# Altium project NMEA2K-Converter-v1.0.PrjPcb (part 1 of 3)
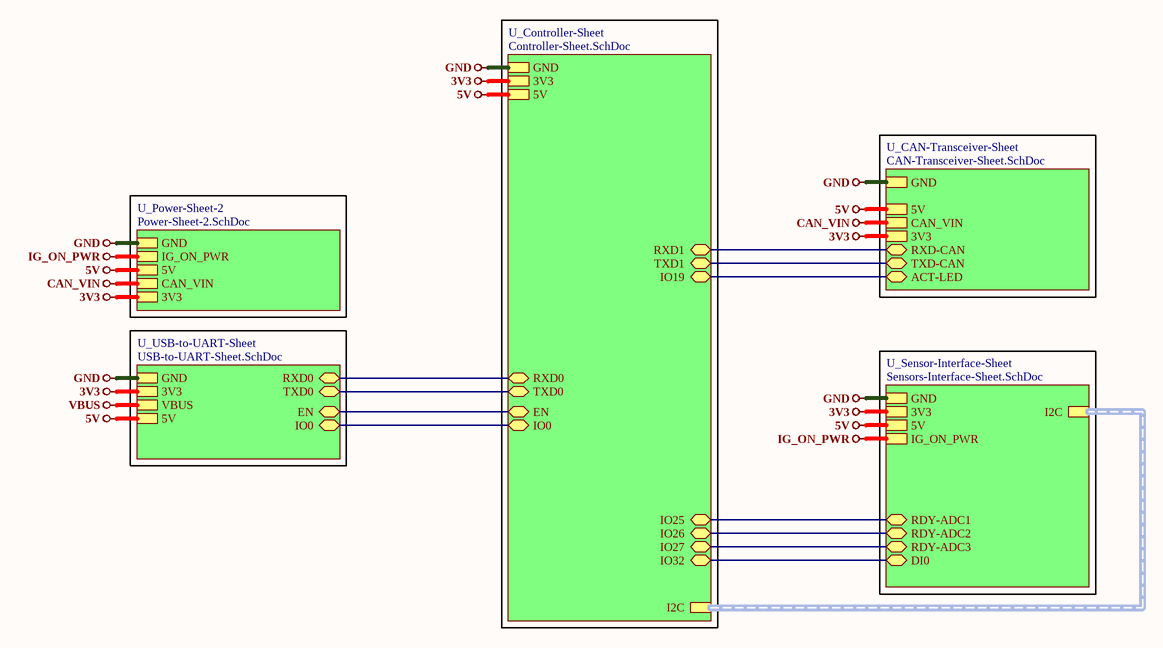
[diagram p0: Top-Sheet.SchDoc]
6 sheets, 138 parts. Net scope: hierarchical (ports join the sheet entries above them; power ports are global).
Board file: NMEA2K-Converter-v1.0.PcbDoc
Sheets:
  Top-Sheet.SchDoc
    U_Power-Sheet-2 = Power-Sheet-2.SchDoc
    U_USB-to-UART-Sheet = USB-to-UART-Sheet.SchDoc
    U_Controller-Sheet = Controller-Sheet.SchDoc
    U_CAN-Transceiver-Sheet = CAN-Transceiver-Sheet.SchDoc
    U_Sensor-Interface-Sheet = Sensors-Interface-Sheet.SchDoc

## Sheet Top-Sheet.SchDoc
size A4; SheetNumber: 1; SheetTotal: 6

### Sub-sheets
U_CAN-Transceiver-Sheet = CAN-Transceiver-Sheet.SchDoc: GND, 3V3, CAN_VIN, RXD-CAN (bidir), TXD-CAN (bidir), ACT-LED (bidir), 5V
U_Controller-Sheet = Controller-Sheet.SchDoc: I2C (harness I2C), GND, 3V3, TXD0 (bidir), RXD0 (bidir), EN (bidir), IO0 (bidir), TXD1 (bidir), RXD1 (bidir), IO25 (bidir), IO26 (bidir), IO27 (bidir), IO19 (bidir), IO32 (bidir), 5V
U_Power-Sheet-2 = Power-Sheet-2.SchDoc: 5V, GND, 3V3, CAN_VIN, IG_ON_PWR
U_Sensor-Interface-Sheet = Sensors-Interface-Sheet.SchDoc: I2C (harness I2C), GND, 3V3, RDY-ADC1 (bidir), RDY-ADC2 (bidir), RDY-ADC3 (bidir), 5V, DI0 (bidir), IG_ON_PWR
U_USB-to-UART-Sheet = USB-to-UART-Sheet.SchDoc: GND, 3V3, EN (bidir), IO0 (bidir), VBUS, RXD0 (bidir), TXD0 (bidir), 5V

### Nets
3V3: sheet U_Power-Sheet-2/3V3, sheet U_USB-to-UART-Sheet/3V3, sheet U_Controller-Sheet/3V3, sheet U_CAN-Transceiver-Sheet/3V3, sheet U_Sensor-Interface-Sheet/3V3
5V: sheet U_Power-Sheet-2/5V, sheet U_USB-to-UART-Sheet/5V, sheet U_Controller-Sheet/5V, sheet U_CAN-Transceiver-Sheet/5V, sheet U_Sensor-Interface-Sheet/5V
CAN_VIN: sheet U_Power-Sheet-2/CAN_VIN, sheet U_CAN-Transceiver-Sheet/CAN_VIN
GND: sheet U_Power-Sheet-2/GND, sheet U_USB-to-UART-Sheet/GND, sheet U_Controller-Sheet/GND, sheet U_CAN-Transceiver-Sheet/GND, sheet U_Sensor-Interface-Sheet/GND
IG_ON_PWR: sheet U_Power-Sheet-2/IG_ON_PWR, sheet U_Sensor-Interface-Sheet/IG_ON_PWR
ACT-LED: sheet U_Controller-Sheet/IO19, sheet U_CAN-Transceiver-Sheet/ACT-LED
DI0: sheet U_Controller-Sheet/IO32, sheet U_Sensor-Interface-Sheet/DI0
EN: sheet U_USB-to-UART-Sheet/EN, sheet U_Controller-Sheet/EN
IO0: sheet U_USB-to-UART-Sheet/IO0, sheet U_Controller-Sheet/IO0
IO25: sheet U_Controller-Sheet/IO25, sheet U_Sensor-Interface-Sheet/RDY-ADC1
IO26: sheet U_Controller-Sheet/IO26, sheet U_Sensor-Interface-Sheet/RDY-ADC2
IO27: sheet U_Controller-Sheet/IO27, sheet U_Sensor-Interface-Sheet/RDY-ADC3
RXD0: sheet U_USB-to-UART-Sheet/RXD0, sheet U_Controller-Sheet/RXD0
RXD-CAN: sheet U_Controller-Sheet/RXD1, sheet U_CAN-Transceiver-Sheet/RXD-CAN
TXD0: sheet U_USB-to-UART-Sheet/TXD0, sheet U_Controller-Sheet/TXD0
TXD-CAN: sheet U_Controller-Sheet/TXD1, sheet U_CAN-Transceiver-Sheet/TXD-CAN

### Buses and harness runs
harness sheet U_Controller-Sheet/I2C = sheet U_Sensor-Interface-Sheet/I2C

### Notes on the sheet
- File:
- Title:
- Date:
- Page
- Num:
- Total:
- Drawn By: Huzaifa Ali

## Sheet Power-Sheet-2.SchDoc
size A4; SheetNumber: 2; SheetTotal: 6
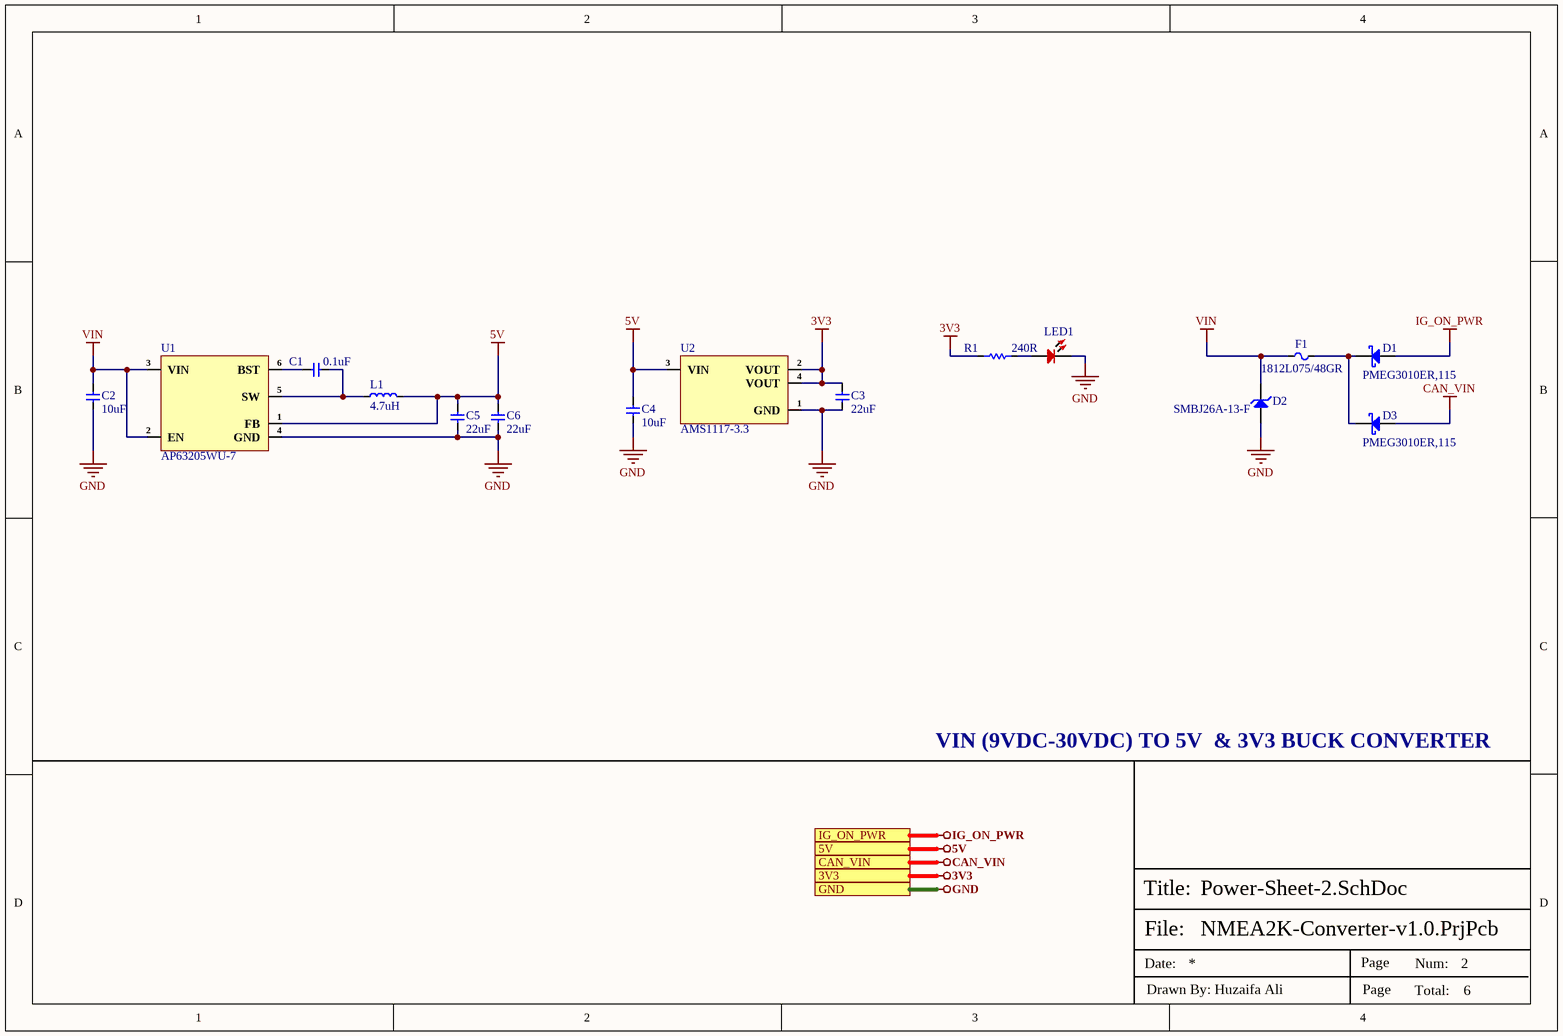
[diagram p1: Power-Sheet-2.SchDoc]

### Parts
C1  0.1uF  [Cap-0402]
C2  10uF  [Cap-1210]
C3  22uF  [Cap-0402]
C4  10uF  [Cap-1210]
C5  22uF  [Cap-0402]
C6  22uF  [Cap-0402]
D1  PMEG3010ER,115  [SOD-123W]
D2  SMBJ26A-13-F  [SMB_]
D3  PMEG3010ER,115  [SOD-123W]
F1  1812L075/48GR  [1812-FUSE]
L1  4.7uH  [SWPA4030S4R7MT_]
LED1  RED  [LED-0603]  (value not drawn)
R1  240R  [Res-0402]
U1  AP63205WU-7  [TSOT-23-6]
U2  AMS1117-3.3  [SOT- 223]

### Ports
3V3 (see Top-Sheet[1B], CAN-Transceiver-Sheet[3D], Controller-Sheet[3D], Sensors-Interface-Sheet[5D], USB-to-UART-Sheet[3D]), 5V (see Top-Sheet[1B], CAN-Transceiver-Sheet[3D], Controller-Sheet[3D], Sensors-Interface-Sheet[5D]), CAN_VIN (see Top-Sheet[1B], CAN-Transceiver-Sheet[3D]), GND (see Top-Sheet[1B], CAN-Transceiver-Sheet[3D], Controller-Sheet[3D], Sensors-Interface-Sheet[5D], USB-to-UART-Sheet[3D]), IG_ON_PWR (see Top-Sheet[1B], Sensors-Interface-Sheet[5D])

### Nets
3V3: C3.2 R1.1 U2.2(VOUT) U2.4(VOUT) ; port 3V3
5V: C4.2 C5.2 C6.2 L1.2 U1.1(FB) U2.3(VIN) ; port 5V
CAN_VIN: D3.1(A) ; port CAN_VIN
GND: C2.1 C3.1 C4.1 C5.1 C6.1 D2.1(A) LED1.2 U1.4(GND) U2.1(GND) ; port GND
IG_ON_PWR: D1.1(A) ; port IG_ON_PWR
VIN: C2.2 D2.2(K) F1.1 U1.2(EN) U1.3(VIN)
NetC1_1: C1.1 L1.1 U1.5(SW)
NetC1_2: C1.2 U1.6(BST)
NetD1_2: D1.2(K) D3.2(K) F1.2
NetLED1_1: LED1.1 R1.2

### Notes on the sheet
- VIN (9VDC-30VDC) TO 5V  & 3V3 BUCK CONVERTER
- File:
- Title:
- Date:
- Page
- Num:
- Total:
- Drawn By: Huzaifa Ali

### Library data of the parts
C1 = CL05B104KB54PNC: CAP CER 0.1UF 50V X7R 0402; Manufacturer: Samsung; Supplier 1: Digi-Key; Manufacturer Part Number: CL05B104KB54PNC; Stock 1: 8594; Pricing 1: 1=0.1, 10=0.067, 50=0.0366, 100=0.0299, 500=0.02138, 1000=0.01681, 2500=0.01528, 5000=0.01406 (USD); Supplier Part Number 1: 1276-CL05B104KB54PNCDKR-ND; LCSC Part Number: C307331
C2 C4 = GRM32ER71J106KA12L: Multilayer Ceramic Capacitors MLCC - SMD/SMT 1210 10uF 63volts *Derate Voltage/Temp; Manufacturer: Murata; Supplier: Avnet; Supplier Part Number: GRM32ER71J106KA12L; Manufacturer Part Number: GRM32ER71J106KA12L; RoHS: Yes; Category: Ceramic Capacitors; Stock: 55000; Pricing: 1000=0.3451, 2000=0.33698, 4000=0.32886, 6000=0.32074, 8000=0.31262 (USD); ComponentLink1URL: http://www.mouser.com/ds/2/281/c02e-2905.pdf?src-supplier=Mouser; ComponentLink1Description: http://www.mouser.com/ds/2/281/c02e-2905.pdf?src-supplier=Mouser; ComponentLink2URL: http://www.farnell.com/datasheets/2079202.pdf?src-supplier=Farnell; ComponentLink2Description: http://www.farnell.com/datasheets/2079202.pdf?src-supplier=Farnell; ComponentLink3URL: http://search.murata.co.jp/Ceramy/image/img/A01X/G101/ENG/GRM32ER71J106KA12-01.pdf?src-supplier=Digi-Key; ComponentLink3Description: http://search.murata.co.jp/Ceramy/image/img/A01X/G101/ENG/GRM32ER71J106KA12-01.pdf?src-supplier=Digi-Key; ComponentLink4URL: https://datasheet.octopart.com/GRM32ER71J106KA12L-Murata-datasheet-22122223.pdf?src-supplier=Future+Electronics; ComponentLink4Description: https://datasheet.octopart.com/GRM32ER71J106KA12L-Murata-datasheet-22122223.pdf?src-supplier=Future+Electronics; ComponentLink5URL: http://psearch.en.murata.com/capacitor/product/GRM32ER71J106KA12%23.pdf?src-supplier=Avnet; ComponentLink5Description: http://psearch.en.murata.com/capacitor/product/GRM32ER71J106KA12%23.pdf?src-supplier=Avnet; ComponentLink6URL: http://www.farnell.com/datasheets/2079202.pdf?src-supplier=Newark; ComponentLink6Description: http://www.farnell.com/datasheets/2079202.pdf?src-supplier=Newark; ComponentLink7URL: http://www.farnell.com/datasheets/2079202.pdf?src-supplier=Element14; ComponentLink7Description: http://www.farnell.com/datasheets/2079202.pdf?src-supplier=Element14; Package: 1210; LCSC Part Number: C437568; Item Type: Capacitor; ComponentLink8Description: LCSC; ComponentLink8URL: https://www.lcsc.com/product-detail/Multilayer-Ceramic-Capacitors-MLCC-SMD-SMT_Murata-Electronics-GRM32ER71J106KA12L_C437568.html
C3 C5 C6 = GRM158R61A226ME15D: CAP CER 22UF 10V X5R 0402; Item Type: Capacitor; Material: 4241ConductorMaterial; Dielectric: 1537DielectricType; Tolerance: 20%; Supplier: Digi-Key; Supplier Part Number: 490-GRM158R61A226ME15DCT-ND; RoHS: Yes; Category: Ceramic Capacitors; Stock: 26634; Pricing: 1=0.45, 10=0.299, 50=0.2202, 100=0.1794, 500=0.1416, 1000=0.11957, 2500=0.11328 (USD); Case/Package: 343Case; Min Operating Temperature: -55°C; Max Operating Temperature: 85°C; Value: 22uF; Voltage Rating: 10V; Voltage Rating (DC): 10V; Length: 1mm; Width: 500um; Height: 800um; Thickness: 800um
D1 D3 = PMEG3010ER,115: DIODE SCHOTTKY 30V 1A SOD123W; Manufacturer: Nexperia; Supplier 1: Digi-Key; Manufacturer Part Number: PMEG3010ER,115; Stock 1: 72983; Pricing 1: 1=0.35, 10=0.282, 25=0.258, 100=0.162, 250=0.1602, 500=0.15, 1000=0.102 (USD); Supplier Part Number 1: 1727-5201-1-ND; LCSC Part Number: C456106
D2 = SMBJ26A-13-F: TVS DIODE 26VWM 42.1VC SMB; Manufacturer: Diodes; Item Type: TVS Diodes; Supplier: Future Electronics; Supplier Part Number: 3363900; Manufacturer Part Number: SMBJ26A-13-F; RoHS: Yes; Stock: 9000; Pricing: 3000=0.0717, 9000=0.069, 15000=0.0677, 30000=0.0661, 60000=0.0635 (USD); ComponentLink1URL: https://datasheet.ciiva.com/15143/getdatasheetpartid-118169-15143570.pdf?src-supplier=Verical; ComponentLink1Description: https://datasheet.ciiva.com/15143/getdatasheetpartid-118169-15143570.pdf?src-supplier=Verical; ComponentLink2URL: https://datasheet.ciiva.com/16211/ds19002-16211003.pdf?src-supplier=Future+Electronics; ComponentLink2Description: https://datasheet.ciiva.com/16211/ds19002-16211003.pdf?src-supplier=Future+Electronics; LCSC Part Number: C135062
F1 = 1812L075/48GR: 48V 750mA 1.5A 1812 Resettable Fuses ROHS; Manufacturer: LUTE; Manufacturer Part Number: 1812L075/48GR; Package: 1812; LCSC Part Number: C19193053; Item Type: Fuses; ComponentLink1Description: LCSC; ComponentLink1URL: https://www.lcsc.com/product-detail/Resettable-Fuses_LUTE-1812L075-48GR_C19193053.html
L1 = SWPA4030S4R7MT: Fixed Ind 4.720%UH 0.06 Ohm 3200M; Manufacturer: Sunlord; Supplier 1: Digi-Key; Manufacturer Part Number: SWPA4030S4R7MT; RoHS: Yes; Category: Fixed Inductors; Stock 1: 3730; Pricing 1: 1=0.44000, 10=0.38900, 25=0.36120, 50=0.30560, 100=0.27780, 250=0.26108, 500=0.23332, 1000=0.18887 (USD); RoHS Compliant: Yes; Supplier Part Number 1: 3442-SWPA4030S4R7MTCT-ND; LCSC Part Number: C57269
LED1 = NCD0603R3: RED LED 0603 Light Emitting Diodes; Manufacturer: Foshan NationStar Optoelectronics; Manufacturer Part Number: NCD0603R3; Package: 0603; Item Type: LED; LCSC Part Number: C3151730; ComponentLink1Description: LCSC; ComponentLink1URL: https://www.lcsc.com/product-detail/Light-Emitting-Diodes-LED_Foshan-NationStar-Optoelectronics-NCD0603R3_C3151730.html
R1 = RC0402FR-07240RL: RES 240 OHM 1% 1/16W 0402; Manufacturer: Yageo; Power Rating: 63mW; Temperature Coefficient: 100ppm/°C; Voltage Rating (DC): 50V; Supplier 1: Mouser; Manufacturer Part Number: RC0402FR-07240RL; RoHS: Yes; Category: Chip SMD Resistors; Stock 1: 1903202; Pricing 1: 1=0.10000, 10=0.01200, 50=0.01200, 100=0.00500, 1000=0.00300, 10000=0.00100 (USD); Case/Package: 0402; Case Code (Metric): 1005; Case Code (Imperial): 0402; Size Code: 0402; Min Operating Temperature: -55°C; Max Operating Temperature: 155°C; Resistance: 240R; Tolerance: 1%; Packaging: Tape and Reel; Resistor Type: Thick Film; Voltage Rating: 50V; Package Quantity: 1; Number of Terminations: 2; Termination: SMD/SMT; Max Power Dissipation: 63mW; Features: Moisture Resistant; Series: RC; Construction: Rectangular; Resistance Tolerance: 1%; Length: 1mm; Width: 0.02inch; Height: 0.016inch; Depth: 0.5mm; REACH SVHC: Unknown; Lead Free: Lead Free; RoHS Compliant: Yes; Military Standard: Not; ComponentLink1URL: https://datasheet.ciiva.com/7849/1018594-7849915.pdf?src-supplier=Element14; ComponentLink1Description: https://datasheet.ciiva.com/7849/1018594-7849915.pdf?src-supplier=Element14; ComponentLink2URL: https://datasheet.ciiva.com/7849/1018594-7849916.pdf?src-supplier=Element14; ComponentLink2Description: https://datasheet.ciiva.com/7849/1018594-7849916.pdf?src-supplier=Element14; ComponentLink3URL: https://datasheet.ciiva.com/2519/pyu-r-int-thick-7-2519157.pdf?src-supplier=Digi-Key; ComponentLink3Description: https://datasheet.ciiva.com/2519/pyu-r-int-thick-7-2519157.pdf?src-supplier=Digi-Key; ComponentLink4URL: https://datasheet.ciiva.com/2519/pyu-r-int-thick-7-2519158.pdf?src-supplier=Digi-Key; ComponentLink4Description: https://datasheet.ciiva.com/2519/pyu-r-int-thick-7-2519158.pdf?src-supplier=Digi-Key; ComponentLink5URL: https://datasheet.ciiva.com/2519/pyu-r-int-thick-7-2519156.pdf?src-supplier=Digi-Key; ComponentLink5Description: https://datasheet.ciiva.com/2519/pyu-r-int-thick-7-2519156.pdf?src-supplier=Digi-Key; ComponentLink6URL: https://datasheet.ciiva.com/12669/pyu-rc0402-51-rohs-l-6-r-12669689.pdf?src-supplier=Mouser; ComponentLink6Description: https://datasheet.ciiva.com/12669/pyu-rc0402-51-rohs-l-6-r-12669689.pdf?src-supplier=Mouser; ComponentLink7URL: https://datasheet.ciiva.com/17419/pyu-rc0402-51-rohs-l-6-r-17419482.pdf?src-supplier=Future+Electronics; ComponentLink7Description: https://datasheet.ciiva.com/17419/pyu-rc0402-51-rohs-l-6-r-17419482.pdf?src-supplier=Future+Electronics; Supplier Part Number 1: 603-RC0402FR-07240RL
U1 = AP63205WU-7: IC REG BUCK 5V 2A TSOT26; Manufacturer: Diodes; Supplier 1: Digi-Key; Manufacturer Part Number: AP63205WU-7; RoHS: Yes; Category: Voltage Regulators - Switching; Stock 1: 88525; Pricing 1: 1=0.88, 10=0.776, 25=0.7292, 100=0.5952, 250=0.55284, 500=0.4705, 1000=0.3764 (USD); Supplier Part Number 1: AP63205WU-7DICT-ND; LCSC Part Number: C2071056; Item Type: IC
U2 = AMS1117-3.3: SOT-223 Linear Voltage Regulators (LDO) ROHS; Manufacturer: GUOXIN JIAPIN SEMICONDUCTOR; Item Type: IC; Manufacturer Part Number: AMS1117-3.3; Package: SOT-223; LCSC Part Number: C2992570; ComponentLink1Description: LCSC; ComponentLink1URL: https://www.lcsc.com/product-detail/Linear-Voltage-Regulators-LDO_GUOXIN-JIAPIN-SEMICONDUCTOR-AMS1117-3-3_C2992570.html

## Sheet USB-to-UART-Sheet.SchDoc
size A4; SheetNumber: 3; SheetTotal: 6
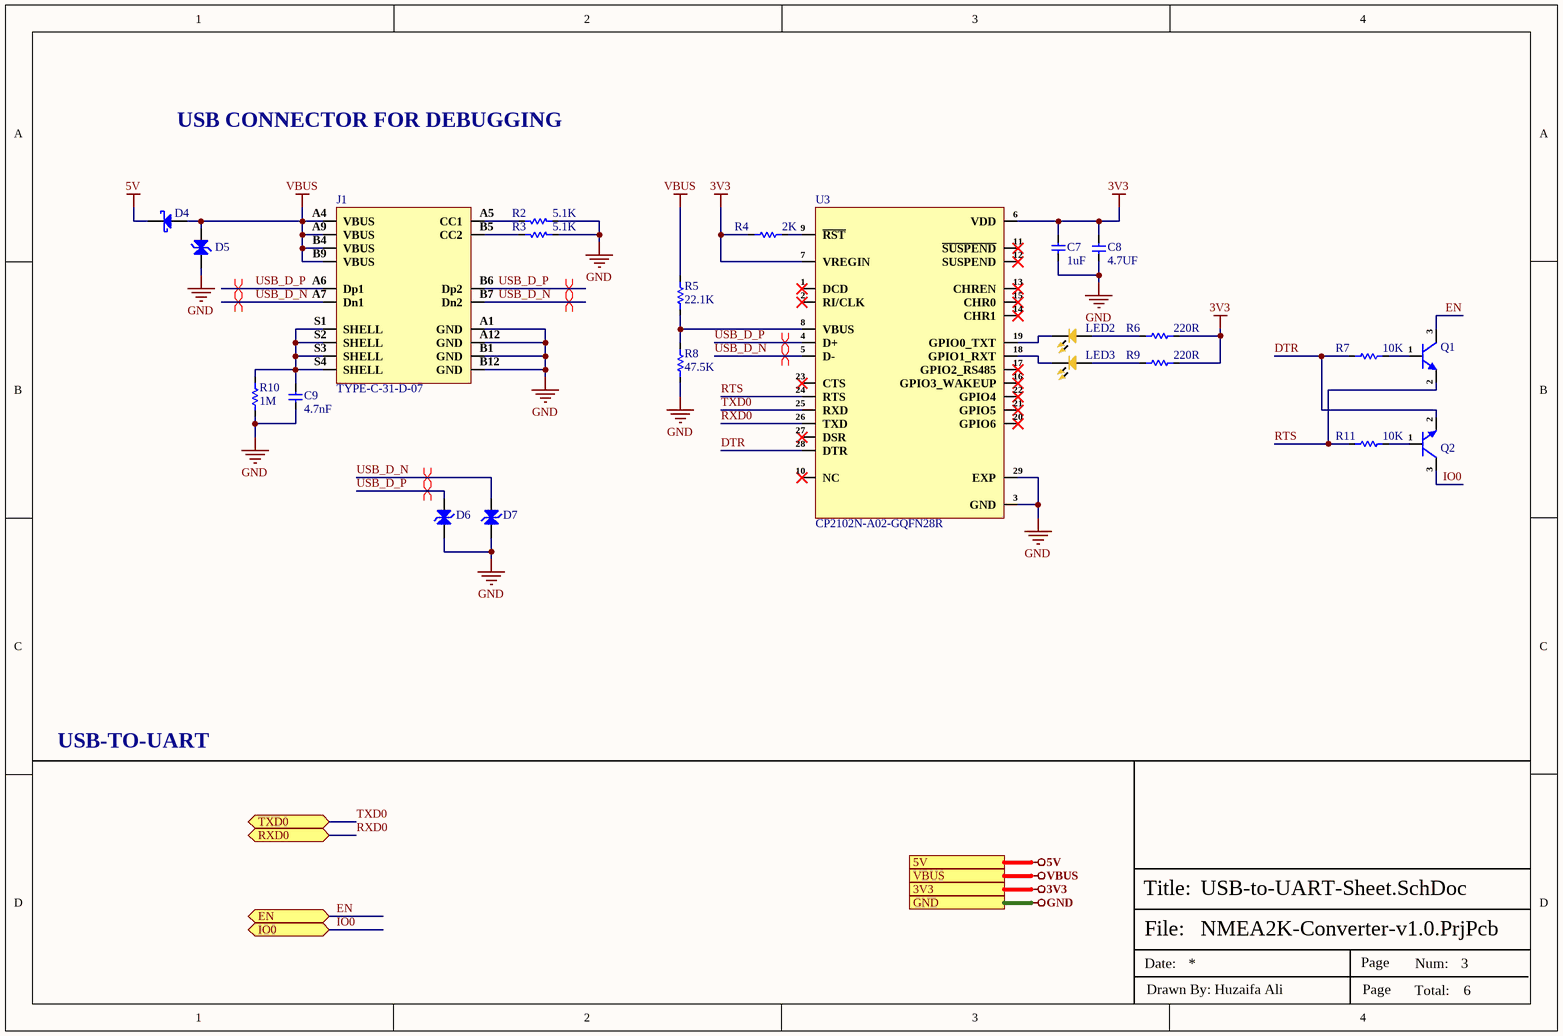
[diagram p2: USB-to-UART-Sheet.SchDoc]

### Parts
C7  1uF  [Cap-0402]
C8  4.7UF  [Cap-0603]
C9  4.7nF  [Cap-1206]
D4  PMEG3010ER,115  [SOD-123W]  (value not drawn)
D5  LESD5D5.0CT1G  [SOD-523]  (value not drawn)
D6  LESD5D5.0CT1G  [SOD-523]  (value not drawn)
D7  LESD5D5.0CT1G  [SOD-523]  (value not drawn)
J1  TYPE-C-31-D-07  [TYPE-C-31-D-07]
LED2  Yellow  [LED-0603]  (value not drawn)
LED3  Yellow  [LED-0603]  (value not drawn)
Q1  SS8050-G  [SOT-23]  (value not drawn)
Q2  SS8050-G  [SOT-23]  (value not drawn)
R2  5.1K  [Res-0402]
R3  5.1K  [Res-0402]
R4  2K  [Res-0402]
R5  22.1K  [Res-0603]
R6  220R  [Res-0603]
R7  10K  [Res-0402]
R8  47.5K  [Res-0603]
R9  220R  [Res-0603]
R10  1M  [Res-0603]
R11  10K  [Res-0402]
U3  CP2102N-A02-GQFN28R  [28-QFN (5x5)_]

### Ports
3V3 (see Top-Sheet[1B], CAN-Transceiver-Sheet[3D], Controller-Sheet[3D], Power-Sheet-2[3D], Sensors-Interface-Sheet[5D]), 5V (see Top-Sheet[1B], CAN-Transceiver-Sheet[3D], Controller-Sheet[3D], Power-Sheet-2[3D], Sensors-Interface-Sheet[5D]), EN (bidir, see Top-Sheet[2B], Controller-Sheet[2D]), GND (see Top-Sheet[1B], CAN-Transceiver-Sheet[3D], Controller-Sheet[3D], Power-Sheet-2[3D], Sensors-Interface-Sheet[5D]), IO0 (bidir, see Top-Sheet[2B], Controller-Sheet[2D]), RXD0 (bidir, see Top-Sheet[2B], Controller-Sheet[2D]), TXD0 (bidir, see Top-Sheet[2B], Controller-Sheet[2D]), VBUS (see Top-Sheet[1B])

### Nets
3V3: C7.1 C8.2 R4.1 R6.2 R9.2 U3.6(VDD) U3.7(VREGIN) ; port 3V3
5V: D4.2(K) ; port 5V
GND: C7.2 C8.1 C9.1 D5.1(A) D6.1(A) D7.1(A) J1.A1(GND) J1.A12(GND) J1.B1(GND) J1.B12(GND) R2.2 R3.2 R8.1 R10.1 U3.3(GND) U3.29(EXP) ; port GND
VBUS: D4.1(A) D5.2(A) J1.A4(VBUS) J1.A9(VBUS) J1.B4(VBUS) J1.B9(VBUS) R5.1 ; port VBUS
DTR: Q2.2(E) R7.1 U3.28(DTR)
EN: Q1.3(C) ; port EN
IO0: Q2.3(C) ; port IO0
RTS: Q1.2(E) R11.1 U3.24(RTS)
RXD0: U3.26(TXD) ; port RXD0
TXD0: U3.25(RXD) ; port TXD0
USB_D_N: D7.2(A) J1.A7(Dn1) J1.B7(Dn2) U3.5(D-)
USB_D_P: D6.2(A) J1.A6(Dp1) J1.B6(Dp2) U3.4(D+)
NetC9_2: C9.2 J1.S1(SHELL) J1.S2(SHELL) J1.S3(SHELL) J1.S4(SHELL) R10.2
NetJ1_A5: J1.A5(CC1) R2.1
NetJ1_B5: J1.B5(CC2) R3.1
NetLED2_1: LED2.1 R6.1
NetLED2_2: LED2.2 U3.19(GPIO0_TXT)
NetLED3_1: LED3.1 R9.1
NetLED3_2: LED3.2 U3.18(GPIO1_RXT)
NetQ1_1: Q1.1(B) R7.2
NetQ2_1: Q2.1(B) R11.2
NetR4_2: R4.2 U3.9(~{RST})
NetR5_2: R5.2 R8.2 U3.8(VBUS)

Not connected (* = marked no-connect by the designer): U3 1(DCD)* 2(RI/CLK)* 10(NC)* 11(~{SUSPEND})* 12(SUSPEND)* 13(CHREN)* 14(CHR1)* 15(CHR0)* 16(GPIO3_WAKEUP)* 17(GPIO2_RS485)* 20(GPIO6)* 21(GPIO5)* 22(GPIO4)* 23(CTS)* 27(DSR)*

### Layout directives
differential pair; net class USB; differential pair class USB_Lines; rule Impedance Constraint [Min = 85.00    Max = 90.00    ]; rule Matched Net Lengths [Tolerance = 50mil]: USB_D_N, USB_D_P

### Notes on the sheet
- USB CONNECTOR FOR DEBUGGING
- USB-TO-UART
- File:
- Title:
- Date:
- Page
- Num:
- Total:
- Drawn By: Huzaifa Ali

### Library data of the parts
C7 = CL05A105KA5NQNC: CAP CER 1UF 25V X5R 0402; Manufacturer: Samsung; Material: Ceramic; Tolerance: 10%; Item Type: Capacitor; Supplier 1: Arrow Electronics; Manufacturer Part Number: CL05A105KA5NQNC; RoHS: Yes; Category: Ceramic Capacitors; Stock 1: 80000; Pricing 1: 10000=0.0256, 20000=0.0238, 30000=0.0228, 50000=0.0207, 100000=0.0175, 250000=0.0157 (USD); Mounting Technology: Surface Mount; Case/Package: 0402; Case Code (Metric): 1005; Case Code (Imperial): 0402; Min Operating Temperature: -55°C; Max Operating Temperature: 85°C; Package Quantity: 10000; Series: CL; Voltage Rating: 25V; Packaging: Tape and Reel; Construction: Flat; Value: 1uF; Dielectric: X5R; Length: 1mm; Width: 0.02inch; Height: 0.5mm; Depth: 0.5mm; Thickness: 0.022inch; Radiation Hardening: No; Lead Free: Lead Free; RoHS Compliant: Yes; ComponentLink1URL: https://datasheet.ciiva.com/25720/cl05a105ka5nqnc-25720771.pdf?src-supplier=Digi-Key; ComponentLink1Description: https://datasheet.ciiva.com/25720/cl05a105ka5nqnc-25720771.pdf?src-supplier=Digi-Key; ComponentLink2URL: https://datasheet.ciiva.com/3777/cl05a105ka5nqnc-3777709.pdf?src-supplier=Arrow+Electronics; ComponentLink2Description: https://datasheet.ciiva.com/3777/cl05a105ka5nqnc-3777709.pdf?src-supplier=Arrow+Electronics; ComponentLink3URL: https://datasheet.ciiva.com/29198/459147-da-01-en-vs-kondensator-0402-29198339.pdf?src-supplier=Conrad; ComponentLink3Description: https://datasheet.ciiva.com/29198/459147-da-01-en-vs-kondensator-0402-29198339.pdf?src-supplier=Conrad; Supplier Part Number 1: CL05A105KA5NQNC; LCSC Part Number: C52923
C8 = CL10A475KA8NQNC: CAP CER 4.7UF 25V X5R 0603; Manufacturer: Samsung; Tolerance: 10%; Supplier 1: Digi-Key; Manufacturer Part Number: CL10A475KA8NQNC; Stock 1: 2252340; Pricing 1: 1=0.37, 10=0.255, 100=0.1528, 500=0.11456, 1000=0.09675 (USD); Mount: Surface Mount; Case/Package: 0603; Case Code (Metric): 1608; Case Code (Imperial): 0603; Contact Plating: Tin; Min Operating Temperature: -55°C; Max Operating Temperature: 85°C; Package Quantity: 1; Packaging: Tape and Reel; Capacitance: 4.7uF; Voltage Rating: 25V; Dielectric: X5R; Termination: Wraparound; Length: 1.6mm; Width: 0.031inch; Thickness: 0.035inch; Depth: 0.8mm; Lead Free: Lead Free; ComponentLink1URL: http://www.samsungsem.com/kr/support/product-search/mlcc/CL10A475KA8NQNC.jsp?src-supplier=Digi-Key; ComponentLink1Description: http://www.samsungsem.com/kr/support/product-search/mlcc/CL10A475KA8NQNC.jsp?src-supplier=Digi-Key; Supplier Part Number 1: 1276-1900-1-ND; LCSC Part Number: C69335
C9 = CC1206KKX7RCBB472: CAP CER 4700PF 1KV X7R 1206; Manufacturer: Yageo; Dielectric Material: Ceramic; Tolerance: 10%; Item Type: Capacitor; Supplier 1: Future Electronics; Manufacturer Part Number: CC1206KKX7RCBB472; RoHS: Yes; Category: Ceramic Capacitors; Stock 1: 180000; Pricing 1: 3000=0.02860, 9000=0.02750, 15000=0.02700, 45000=0.02600, 75000=0.02510 (USD); Mount: Surface Mount; Case/Package: 1206; Number of Pins: 2; Case Code (Imperial): 1206; Case Code (Metric): 3216; Weight: 0.000571oz; Min Operating Temperature: -55°C; Max Operating Temperature: 125°C; Voltage Rating: 1kV; Capacitance: 4.7nF; Packaging: Tape and Reel; Voltage Rating (DC): 1kV; Dielectric: X7R; Termination: SMD/SMT; Resistor Type: Ceramic; Series: CC; Length: 3.2mm; Width: 0.063inch; Thickness: 0.057inch; Depth: 1.6mm; Radiation Hardening: No; Lead Free: Lead Free; RoHS Compliant: Yes; ComponentLink1URL: https://datasheet.ciiva.com/13208/upy-gp-np0-16v-to-50v-8-13208693.pdf?src-supplier=Mouser; ComponentLink1Description: https://datasheet.ciiva.com/13208/upy-gp-np0-16v-to-50v-8-13208693.pdf?src-supplier=Mouser; ComponentLink2URL: https://datasheet.ciiva.com/11466/hv-11466701.pdf?src-supplier=Avnet; ComponentLink2Description: https://datasheet.ciiva.com/11466/hv-11466701.pdf?src-supplier=Avnet; Supplier Part Number 1: 7130131; LCSC Part Number: C107198
D4 = PMEG3010ER,115: as D1 on sheet Power-Sheet-2; Supplier 1: Digi-Key; Manufacturer Part Number: PMEG3010ER,115; Stock 1: 72983; Pricing 1: 1=0.35, 10=0.282, 25=0.258, 100=0.162, 250=0.1602, 500=0.15, 1000=0.102 (USD); Supplier Part Number 1: 1727-5201-1-ND; LCSC Part Number: C456106
D5-D7 = LESD5D5.0CT1G: SOD-523 ESD Protection Devices ROHS; Manufacturer: UMW; Manufacturer Part Number: LESD5D5.0CT1G; Package: SOD-523; LCSC Part Number: C5199850; Item Type: Protection Device; ComponentLink1Description: LCSC; ComponentLink1URL: https://www.lcsc.com/product-detail/span-style-background-color-ff0-ESD-span-Protection-Devices_UMW-Youtai-Semiconductor-Co-Ltd-LESD5D5-0CT1G_C5199850.html
J1 = TYPE-C-31-D-07: 1 Brick nogging 14P Female Type-C SMD USB Connectors ROHS; Manufacturer: Korean Hroparts Elec; Manufacturer Part Number: TYPE-C-31-D-07; Package: SMD; Item Type: USB Connector; ComponentLink1Description: LCSC; ComponentLink1URL: https://www.lcsc.com/product-detail/USB-Connectors_Korean-Hroparts-Elec-TYPE-C-31-D-07_C2689965.html
LED2 LED3 = NCD0603Y2: yellow 0603 Light Emitting Diodes (LED) ROHS; Manufacturer: Foshan NationStar Optoelectronics; Manufacturer Part Number: NCD0603Y2; Package: 0603; LCSC Part Number: C89811; Item Type: LED; ComponentLink1Description: LCSC; ComponentLink1URL: https://www.lcsc.com/product-detail/Light-Emitting-Diodes-LED_Foshan-NationStar-Optoelectronics-NCD0603Y2_C89811.html
Q1 Q2 = SS8050-G: 25V 300mW 120@100mA,1V 1.5A NPN SOT-23 Bipolar Transistors - BJT ROHS; Manufacturer: Jiangsu Changjing Electronics Technology; Manufacturer Part Number: SS8050-G; Package: SOT-23; LCSC Part Number: C164886; Itype Type: Transistor; ComponentLink1Description: LCSC; ComponentLink1URL: https://www.lcsc.com/product-detail/Bipolar-Transistors-BJT_Jiangsu-Changjing-Electronics-Technology-Co-Ltd-SS8050-G_C164886.html
R2 R3 = RC0402FR-075K1L: RES 5.1K OHM 1% 1/16W 0402; Manufacturer: Yageo; Power Rating: 63mW; Temperature Coefficient: 100ppm/°C; Resistance: 5.1kR; Voltage Rating: 50V; Item Type: Resistor; Supplier 1: Avnet; Manufacturer Part Number: RC0402FR-075K1L; RoHS: Yes; Category: Chip SMD Resistors; Stock 1: 65000; Pricing 1: 10000=0.00085 (USD); Case/Package: 0402; Case Code (Imperial): 0402; Case Code (Metric): 1005; Min Operating Temperature: -55°C; Max Operating Temperature: 155°C; Tolerance: 1%; Series: RC; Packaging: Tape and Reel; Package Quantity: 1; Termination: SMD/SMT; Resistor Type: Thick Film; Number of Terminations: 2; Max Power Dissipation: 63mW; Voltage Rating (DC): 50V; Features: Moisture Resistant; Resistance Tolerance: 1%; Construction: Rectangular; Length: 1mm; Width: 0.02inch; Height: 0.016inch; Depth: 0.5mm; RoHS Compliant: Yes; Military Standard: Not; Lead Free: Lead Free; ComponentLink1URL: https://datasheet.ciiva.com/7983/1018594-7983519.pdf?src-supplier=Element14; ComponentLink1Description: https://datasheet.ciiva.com/7983/1018594-7983519.pdf?src-supplier=Element14; ComponentLink2URL: https://datasheet.ciiva.com/46394/1018594-46394936.pdf?src-supplier=Element14; ComponentLink2Description: https://datasheet.ciiva.com/46394/1018594-46394936.pdf?src-supplier=Element14; ComponentLink3URL: https://datasheet.ciiva.com/2453/pyu-r-int-thick-7-2453401.pdf?src-supplier=Digi-Key; ComponentLink3Description: https://datasheet.ciiva.com/2453/pyu-r-int-thick-7-2453401.pdf?src-supplier=Digi-Key; ComponentLink4URL: https://datasheet.ciiva.com/2453/pyu-r-int-thick-7-2453402.pdf?src-supplier=Digi-Key; ComponentLink4Description: https://datasheet.ciiva.com/2453/pyu-r-int-thick-7-2453402.pdf?src-supplier=Digi-Key; ComponentLink5URL: https://datasheet.ciiva.com/2453/pyu-r-int-thick-7-2453400.pdf?src-supplier=Digi-Key; ComponentLink5Description: https://datasheet.ciiva.com/2453/pyu-r-int-thick-7-2453400.pdf?src-supplier=Digi-Key; Supplier Part Number 1: RC0402FR-075K1L; LCSC Part Number: C105872; Technology: THICK FILM; Working Voltage: 50V; ComponentLink6URL: https://datasheet.ciiva.com/12558/pyu-rc0402-51-rohs-l-6-r-8721-12558460.pdf?src-supplier=Mouser; ComponentLink6Description: https://datasheet.ciiva.com/12558/pyu-rc0402-51-rohs-l-6-r-8721-12558460.pdf?src-supplier=Mouser; ComponentLink7URL: https://datasheet.ciiva.com/16744/pyu-rc0402-51-rohs-l-6-r-16744283.pdf?src-supplier=Future+Electronics; ComponentLink7Description: https://datasheet.ciiva.com/16744/pyu-rc0402-51-rohs-l-6-r-16744283.pdf?src-supplier=Future+Electronics; ComponentLink8URL: https://datasheet.ciiva.com/15189/getdatasheetpartid-323636-15189493.pdf?src-supplier=Verical; ComponentLink8Description: https://datasheet.ciiva.com/15189/getdatasheetpartid-323636-15189493.pdf?src-supplier=Verical
R4 = RC0402FR-072KL: RES 2K OHM 1% 1/16W 0402; Item Type: Resistor; Value: 2kR; Power Rating: 63mW; Voltage Rating: 50V; Temperature Coefficient: 100ppm/°C; LCSC Part Number: C60488; ComponentLink1Description: LCSC; Supplier: Future Electronics; Supplier Part Number: 7970452; RoHS: Yes; Category: Chip SMD Resistors; Stock: 10370000; Pricing: 10000=0.0007, 50000=0.0008, 100000=0.0006, 300000=0.0006, 750000=0.0006, 1000000=0.0007, 2000000=0.0005, 3000000=0.0006 (USD); Case/Package: 0402; Case Code (Metric): 1005; Case Code (Imperial): 0402; Min Operating Temperature: -55°C; Max Operating Temperature: 155°C; Package Quantity: 1; Packaging: Tape and Reel; Resistor Type: Thick Film; Termination: SMD/SMT; Series: RC; Tolerance: 1%; Number of Terminations: 2; Max Power Dissipation: 63mW; Working Voltage: 50V; Features: Moisture Resistant; Technology: THICK FILM; Construction: Rectangular; Resistance Tolerance: 1%; Voltage Rating (DC): 50V; Length: 0.039inch; Width: 0.02inch; Height: 0.016inch; Depth: 0.5mm; RoHS Compliant: Yes; Military Standard: Not; Reach SVHC Compliant: Unknown; Lead Free: 5697LeadFree; ComponentLink2URL: https://datasheet.ciiva.com/11808/0900766b80c66297-11808787.pdf?src-supplier=Rs; ComponentLink2Description: https://datasheet.ciiva.com/11808/0900766b80c66297-11808787.pdf?src-supplier=Rs; ComponentLink3URL: https://datasheet.ciiva.com/7849/1018594-7849934.pdf?src-supplier=Element14; ComponentLink3Description: https://datasheet.ciiva.com/7849/1018594-7849934.pdf?src-supplier=Element14; ComponentLink4URL: https://datasheet.ciiva.com/7849/1018594-7849935.pdf?src-supplier=Element14; ComponentLink4Description: https://datasheet.ciiva.com/7849/1018594-7849935.pdf?src-supplier=Element14; ComponentLink5URL: https://datasheet.ciiva.com/7983/1018594-7983517.pdf?src-supplier=Element14; ComponentLink5Description: https://datasheet.ciiva.com/7983/1018594-7983517.pdf?src-supplier=Element14; ComponentLink6URL: https://datasheet.ciiva.com/2453/pyu-r-int-thick-7-2453635.pdf?src-supplier=Digi-Key; ComponentLink6Description: https://datasheet.ciiva.com/2453/pyu-r-int-thick-7-2453635.pdf?src-supplier=Digi-Key; ComponentLink7URL: https://datasheet.ciiva.com/2453/pyu-r-int-thick-7-2453636.pdf?src-supplier=Digi-Key; ComponentLink7Description: https://datasheet.ciiva.com/2453/pyu-r-int-thick-7-2453636.pdf?src-supplier=Digi-Key; ComponentLink8URL: https://datasheet.ciiva.com/2453/pyu-r-int-thick-7-2453634.pdf?src-supplier=Digi-Key; ComponentLink8Description: https://datasheet.ciiva.com/2453/pyu-r-int-thick-7-2453634.pdf?src-supplier=Digi-Key; ComponentLink9URL: https://datasheet.ciiva.com/12667/pyu-rc0402-51-rohs-l-6-r-12667451.pdf?src-supplier=Mouser; ComponentLink9Description: https://datasheet.ciiva.com/12667/pyu-rc0402-51-rohs-l-6-r-12667451.pdf?src-supplier=Mouser; ComponentLink10URL: https://datasheet.ciiva.com/15189/getdatasheetpartid-358921-15189414.pdf?src-supplier=Verical; ComponentLink10Description: https://datasheet.ciiva.com/15189/getdatasheetpartid-358921-15189414.pdf?src-supplier=Verical
R5 = RC0603FR-0722K1L: RES 22.1K OHM 1% 1/10W 0603; Manufacturer: Yageo; Power Rating: 100mW; Resistance: 22.1kR; Voltage Rating: 50V; Temperature Coefficient: 100ppm/°C; Item Type: Resistor; Supplier 1: Avnet; Manufacturer Part Number: RC0603FR-0722K1L; RoHS: Yes; Category: Chip SMD Resistors; Stock 1: 595000; Pricing 1: 5000=0.00133, 10000=0.00131, 20000=0.00127 (USD); Case/Package: 0603; Case Code (Imperial): 0603; Case Code (Metric): 1608; Size Code: 0603; Min Operating Temperature: -55°C; Max Operating Temperature: 155°C; Tolerance: 1%; Package Quantity: 5000; Packaging: Tape and Reel; Termination: SMD/SMT; Voltage Rating (DC): 50V; Series: RC; Length: 1.6mm; Width: 0.8mm; Height: 0.45mm; Lead Free: Lead Free; RoHS Compliant: Yes; ComponentLink1URL: https://datasheet.ciiva.com/12555/rc0603-272842-12555287.pdf?src-supplier=Mouser; ComponentLink1Description: https://datasheet.ciiva.com/12555/rc0603-272842-12555287.pdf?src-supplier=Mouser; Supplier Part Number 1: RC0603FR-0722K1L; LCSC Part Number: C137768
R6 R9 = RC0603FR-07220RL: RES SMD 220 OHM 1% 1/10W 0603; Manufacturer: Yageo; Temperature Coefficient: 100ppm/°C; Voltage Rating (DC): 50V; Power Rating: 100mW; Item Type: Resistor; Supplier 1: Digi-Key; Manufacturer Part Number: RC0603FR-07220RL; Stock 1: 5843995; Pricing 1: 1=0.1, 10=0.023, 100=0.0094, 1000=0.00421, 2500=0.00366 (USD); Case/Package: 0603; Number of Pins: 2; Case Code (Imperial): 0603; Case Code (Metric): 1608; Min Operating Temperature: -55°C; Max Operating Temperature: 155°C; Resistance: 220R; Tolerance: 1%; Composition: Thick Film; Packaging: Tape and Reel; Voltage Rating: 50V; Package Quantity: 1; Termination: SMD/SMT; Number of Terminations: 2; Military Standard: Not; Max Power Dissipation: 100mW; Features: Moisture Resistant; Length: 1.6mm; Height: 0.022inch; Width: 0.031inch; Depth: 0.8mm; REACH SVHC: No SVHC; Lead Free: Lead Free; ComponentLink1URL: http://www.yageo.com/documents/recent/PYu-RC_Group_51_RoHS_L_10.pdf?src-supplier=Digi-Key; ComponentLink1Description: http://www.yageo.com/documents/recent/PYu-RC_Group_51_RoHS_L_10.pdf?src-supplier=Digi-Key; ComponentLink2URL: http://www.farnell.com/datasheets/1868787.pdf?src-supplier=Element14; ComponentLink2Description: http://www.farnell.com/datasheets/1868787.pdf?src-supplier=Element14; Supplier Part Number 1: 311-220HRCT-ND; LCSC Part Number: C107696
R7 R11 = RC0402FR-0710KL: RES 10K OHM 1% 1/16W 0402; Manufacturer: Yageo; Resistance: 10kR; Voltage Rating (DC): 50V; Temperature Coefficient: 100ppm/°C; Power Rating: 62.5mW; Max Power Dissipation: 63mW; Item Type: Resistor; Supplier 1: Mouser; Manufacturer Part Number: RC0402FR-0710KL; RoHS: Yes; Category: Chip SMD Resistors; Stock 1: 18648329; Pricing 1: 1=0.10000, 10=0.01400, 50=0.01400, 100=0.00500, 1000=0.00300, 10000=0.00200 (USD); Case/Package: 0402; Number of Pins: 2; Case Code (Imperial): 0402; Case Code (Metric): 1005; Min Operating Temperature: -55°C; Max Operating Temperature: 155°C; Resistor Type: Thick Film; Tolerance: 1%; Packaging: Tape and Reel; Voltage Rating: 50V; Termination: SMD/SMT; Working Voltage: 50V; Number of Terminations: 2; Features: Moisture Resistant; Series: RC; Resistance Tolerance: 1%; Construction: Rectangular; Length: 1mm; Width: 0.5mm; Height: 0.32mm; Depth: 0.5mm; Lead Pitch: 0.2mm; REACH SVHC: No SVHC; Lead Free: Lead Free; RoHS Compliant: Yes; Military Standard: Not; ComponentLink1URL: https://datasheet.ciiva.com/7660/38568-7660787.pdf?src-supplier=Element14; ComponentLink1Description: https://datasheet.ciiva.com/7660/38568-7660787.pdf?src-supplier=Element14; ComponentLink2URL: https://datasheet.ciiva.com/7849/1686128-7849814.pdf?src-supplier=Element14; ComponentLink2Description: https://datasheet.ciiva.com/7849/1686128-7849814.pdf?src-supplier=Element14; ComponentLink3URL: https://datasheet.ciiva.com/7983/1018594-7983486.pdf?src-supplier=Element14; ComponentLink3Description: https://datasheet.ciiva.com/7983/1018594-7983486.pdf?src-supplier=Element14; ComponentLink4URL: https://datasheet.ciiva.com/22747/1018594-22747512.pdf?src-supplier=Element14; ComponentLink4Description: https://datasheet.ciiva.com/22747/1018594-22747512.pdf?src-supplier=Element14; ComponentLink5URL: https://datasheet.ciiva.com/12667/pyu-rc0402-51-rohs-l-6-r-12667067.pdf?src-supplier=Mouser; ComponentLink5Description: https://datasheet.ciiva.com/12667/pyu-rc0402-51-rohs-l-6-r-12667067.pdf?src-supplier=Mouser; ComponentLink6URL: https://datasheet.ciiva.com/7849/1784430-7849813.pdf?src-supplier=Element14; ComponentLink6Description: https://datasheet.ciiva.com/7849/1784430-7849813.pdf?src-supplier=Element14; ComponentLink7URL: https://datasheet.ciiva.com/7849/1784430-7849815.pdf?src-supplier=Element14; ComponentLink7Description: https://datasheet.ciiva.com/7849/1784430-7849815.pdf?src-supplier=Element14; Supplier Part Number 1: 603-RC0402FR-0710KL; LCSC Part Number: C60490
R8 = RC0603FR-0747K5L: RES 47.5K OHM 1% 1/10W 0603; Manufacturer: Yageo; Resistance: 47.5kR; Power Rating: 100mW; Voltage Rating: 50V; Temperature Coefficient: 100ppm/°C; Item Type: Resistor; Supplier 1: Avnet; Manufacturer Part Number: RC0603FR-0747K5L; RoHS: Yes; Category: Chip SMD Resistors; Stock 1: 20000; Pricing 1: 5000=0.00133, 10000=0.00131, 20000=0.00127 (USD); Case/Package: 0603; Number of Pins: 2; Case Code (Metric): 1608; Case Code (Imperial): 0603; Size Code: 0603; Min Operating Temperature: -55°C; Max Operating Temperature: 155°C; Tolerance: 1%; Package Quantity: 5000; Packaging: Tape and Reel; Resistor Type: Thick Film; Number of Terminations: 2; Termination: SMD/SMT; Max Power Dissipation: 100mW; Voltage Rating (DC): 50V; Features: Moisture Resistant; Series: RC; Technology: THICK FILM; Construction: Rectangular; Resistance Tolerance: 1%; Length: 1.6mm; Width: 0.031inch; Height: 0.45mm; Depth: 0.8mm; RoHS Compliant: Yes; Reach SVHC Compliant: Yes; Military Standard: Not; Lead Free: Lead Free; ComponentLink1URL: https://datasheet.ciiva.com/11808/0900766b80f96399-11808343.pdf?src-supplier=RSComponents; ComponentLink1Description: https://datasheet.ciiva.com/11808/0900766b80f96399-11808343.pdf?src-supplier=RSComponents; ComponentLink2URL: https://datasheet.ciiva.com/2454/pyu-r-int-thick-7-2454790.pdf?src-supplier=Digi-Key; ComponentLink2Description: https://datasheet.ciiva.com/2454/pyu-r-int-thick-7-2454790.pdf?src-supplier=Digi-Key; ComponentLink3URL: https://datasheet.ciiva.com/2454/pyu-r-int-thick-7-2454791.pdf?src-supplier=Digi-Key; ComponentLink3Description: https://datasheet.ciiva.com/2454/pyu-r-int-thick-7-2454791.pdf?src-supplier=Digi-Key; ComponentLink4URL: https://datasheet.ciiva.com/2454/pyu-r-int-thick-7-2454789.pdf?src-supplier=Digi-Key; ComponentLink4Description: https://datasheet.ciiva.com/2454/pyu-r-int-thick-7-2454789.pdf?src-supplier=Digi-Key; ComponentLink5URL: https://datasheet.ciiva.com/12555/rc0603-272842-12555285.pdf?src-supplier=Mouser; ComponentLink5Description: https://datasheet.ciiva.com/12555/rc0603-272842-12555285.pdf?src-supplier=Mouser; ComponentLink6URL: https://datasheet.ciiva.com/15189/getdatasheetpartid-135115-15189741.pdf?src-supplier=Verical; ComponentLink6Description: https://datasheet.ciiva.com/15189/getdatasheetpartid-135115-15189741.pdf?src-supplier=Verical; Supplier Part Number 1: RC0603FR-0747K5L; LCSC Part Number: C137715
R10 = RC0603FR-071ML: RES SMD 1M OHM 1% 1/10W 0603; Manufacturer: Yageo; Voltage Rating: 50V; Resistance: 1MR; Power Rating: 100mW; Temperature Coefficient: 100ppm/°C; Item Type: Resistor; Supplier 1: Digi-Key; Manufacturer Part Number: RC0603FR-071ML; Stock 1: 3824601; Pricing 1: 1=0.1, 10=0.023, 100=0.0094, 1000=0.00421, 2500=0.00366 (USD); Case/Package: 0603; Number of Pins: 2; Case Code (Imperial): 0603; Case Code (Metric): 1608; Min Operating Temperature: -55°C; Max Operating Temperature: 155°C; Voltage Rating (DC): 50V; Tolerance: 1%; Packaging: Tape and Reel; Package Quantity: 5000; Termination: SMD/SMT; Composition: Thick Film; Military Standard: Not; Length: 1.6mm; Height: 0.45mm; Width: 0.8mm; Depth: 0.8mm; REACH SVHC: No SVHC; Lead Free: Lead Free; ComponentLink1URL: http://www.farnell.com/datasheets/2167052.pdf?src-supplier=Mouser; ComponentLink1Description: http://www.farnell.com/datasheets/2167052.pdf?src-supplier=Mouser; ComponentLink2URL: http://www.farnell.com/datasheets/2167052.pdf?src-supplier=Element14; ComponentLink2Description: http://www.farnell.com/datasheets/2167052.pdf?src-supplier=Element14; ComponentLink3URL: http://documents.rs-components.com/techlib://itc_doclist_GB.htm?stockno=5048956&src-supplier=RSComponents; ComponentLink3Description: http://documents.rs-components.com/techlib://itc_doclist_GB.htm?stockno=5048956&src-supplier=RSComponents; Supplier Part Number 1: 311-1.00MHRDKR-ND; LCSC Part Number: C105578
U3 = CP2102N-A02-GQFN28R: Full Speed USB to UART Bridge USB 2.0 3.3V T/R Automotive 28-Pin QFN EP; Manufacturer: Silicon Labs; Operating Supply Current: 9.5mA; Supplier: Arrow Electronics; Supplier Part Number: CP2102N-A02-GQFN28R; Manufacturer Part Number: CP2102N-A02-GQFN28R; RoHS: Yes; Category: USB Interface ICs; Stock: 16500; Pricing: 1500=2.369, 3000=2.265 (USD); Case/Package: QFN; Min Operating Temperature: -40°C; Max Operating Temperature: 85°C; Interface: UART; Series: USBXpress™; Packaging: Cut Tape; ComponentLink1URL: https://www.silabs.com/documents/public/data-sheets/cp2102n-datasheet.pdf?src-supplier=Digikey; ComponentLink1Description: https://www.silabs.com/documents/public/data-sheets/cp2102n-datasheet.pdf?src-supplier=Digikey; ComponentLink2URL: https://4donline.ihs.com/images/VipMasterIC/IC/SILC/SILC-S-A0007770867/SILC-S-A0007770867-1.pdf?hkey=6D3A4C79FDBF58556ACFDE234799DDF0&src-supplier=Farnell; ComponentLink2Description: https://4donline.ihs.com/images/VipMasterIC/IC/SILC/SILC-S-A0007770867/SILC-S-A0007770867-1.pdf?hkey=6D3A4C79FDBF58556ACFDE234799DDF0&src-supplier=Farnell